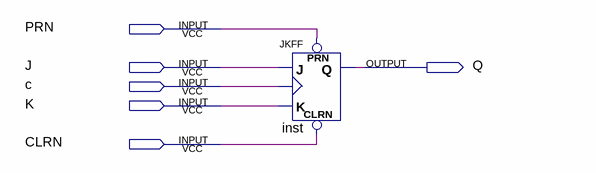
[diagram p0: schematic sheet]
// Quartus schematic JKFFpoint.bdf as structural Verilog: 1 symbols, 6 pins
module JKFFpoint (
  input  PRN,
  input  J,
  input  c,
  input  K,
  input  CLRN,
  output Q
);

  JKFF inst (.PRN(PRN), .CLRN(CLRN), .K(K), .J(J), .CLK(c), .Q(Q));
endmodule
